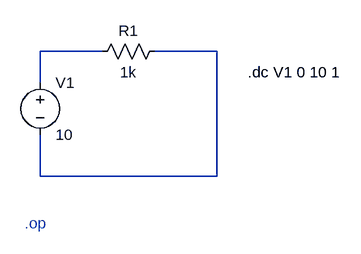
[diagram p0: schematic ohms law.asc]
ohms law.asc, the LTspice schematic file:
Version 4.1
SHEET 1 880 680
WIRE 144 80 48 80
WIRE 320 80 224 80
WIRE 48 128 48 80
WIRE 48 272 48 208
WIRE 320 272 320 80
WIRE 320 272 48 272
SYMBOL res 128 96 R270
WINDOW 0 32 56 VTop 2
WINDOW 3 0 56 VBottom 2
SYMATTR InstName R1
SYMATTR Value 1k
SYMBOL voltage 48 112 R0
WINDOW 123 0 0 Left 0
WINDOW 39 0 0 Left 0
SYMATTR InstName V1
SYMATTR Value 10
TEXT 24 344 Left 2 ;.op
TEXT 368 112 Left 2 !.dc V1 0 10 1

The netlist it stands for:
* ohms law.asc
R1 N001 N002 1k
V1 N001 N002 10
* .op
.dc V1 0 10 1
.backanno
.end